# Altium schematic sheet NTC.SchDoc
size A4; SheetNumber: 6; SheetTotal: 6
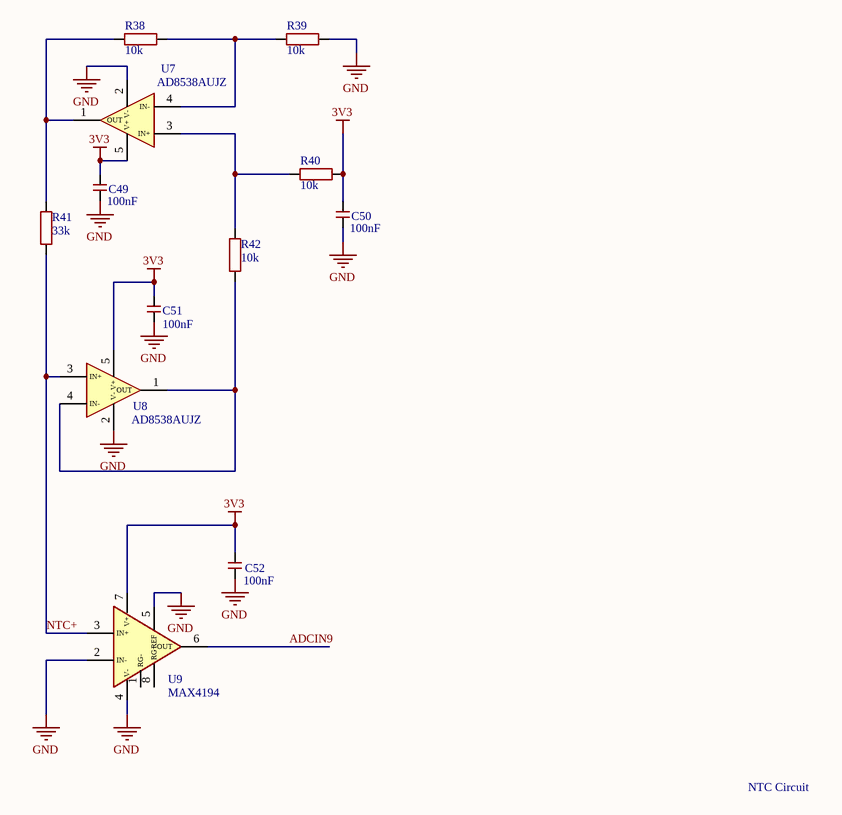
[diagram p0: NTC.SchDoc]

## Parts
C49  100nF  [C0402]
C50  100nF  [C0402]
C51  100nF  [C0402]
C52  100nF  [C0402]
R38  10k  [R0402]
R39  10k  [R0402]
R40  10k  [R0402]
R41  33k  [R0402]
R42  10k  [R0402]
U7  AD8538AUJZ  [SOT95P280X100-5N]
U8  AD8538AUJZ  [SOT95P280X100-5N]
U9  MAX4194  [SOIC127P600X175-8N]

## Nets
3V3: C49.2 C50.2 C51.2 C52.2 R40.2 U7.5(V+) U8.5(V+) U9.7(V+)
GND: C49.1 C50.1 C51.1 C52.1 R39.2 U7.2(V-) U8.2(V-) U9.2(IN-) U9.4(V-) U9.5(REF)
ADCIN9: U9.6(OUT)
NTC+: R41.1 U8.3(IN+) U9.3(IN+)
NetR38_1: R38.1 R41.2 U7.1(OUT)
NetR38_2: R38.2 R39.1 U7.4(IN-)
NetR40_1: R40.1 R42.2 U7.3(IN+)
NetR42_1: R42.1 U8.1(OUT) U8.4(IN-)

Not connected (* = marked no-connect by the designer): U9 1(RG-) 8(RG+)

## Notes on the sheet
- NTC Circuit

## Library data of the parts
C49-C52 = C0402C104K3PACTU: Ceramic Capacitor, Multilayer, Ceramic, 25V, 10% +Tol, 10% -Tol, X5R, 15% TC, 0.1uF, Surface Mount, 0402; Manufacturer: KEMET; Multilayer: Yes; Supplier: Mouser; Supplier Part Number: 80-C0402C104K3P; Manufacturer Part Number: C0402C104K3PACTU; RoHS: Yes; Category: Ceramic Capacitors; Stock: 262570; Pricing: 1=0.12, 10=0.056, 50=0.056, 100=0.036, 1000=0.026, 10000=0.017 (USD); Mounting Technology: Surface Mount; Pins: 2; Dielectric Material: Ceramic; Package Shape: Rectangular; Case/Package: 0402; Terminal Finish: Nickel; Min Operating Temperature: -55°C; Max Operating Temperature: 85°C; JESD-609 Code: e3; Value: 100nF; Capacitor Type: Ceramic; Tolerance  (fill in as +-): 10%; Packaging: Tape and Reel; Tolerance (fill in as +-): 10%; Rated DC Voltage (URdc): 25V; Temperature Characteristics Code: X5R; Termination: Wraparound; Reach SVHC Compliant: Yes; RoHS Compliant: Yes; ComponentLink1URL: https://datasheet.ciiva.com:443/pdfs/VipMasterIC/IC/KEME/KEME-S-A0008991665/KEME-S-A0008991665-1.pdf?src-supplier=IHS+Markit; ComponentLink1Description: https://datasheet.ciiva.com:443/pdfs/VipMasterIC/IC/KEME/KEME-S-A0008991665/KEME-S-A0008991665-1.pdf?src-supplier=IHS+Markit; ComponentLink2URL: http://www.farnell.com/datasheets/2748284.pdf?src-supplier=Farnell; ComponentLink2Description: http://www.farnell.com/datasheets/2748284.pdf?src-supplier=Farnell; ComponentLink3URL: http://www.farnell.com/datasheets/2748284.pdf?src-supplier=Newark; ComponentLink3Description: http://www.farnell.com/datasheets/2748284.pdf?src-supplier=Newark; ComponentLink4URL: https://datasheet.octopart.com/C0402C104K3PACTU-KEMET-datasheet-181956028.pdf?src-supplier=Element14; ComponentLink4Description: https://datasheet.octopart.com/C0402C104K3PACTU-KEMET-datasheet-181956028.pdf?src-supplier=Element14
R38-R40 R42 = RP0402BRD0710KL: Resistor, 10K, 0.1%, 0.063W, THIN FILM, 0402;; Manufacturer: Yageo; Supplier: Mouser; Supplier Part Number: 603-RP0402BRD0710KL; Manufacturer Part Number: RP0402BRD0710KL; RoHS: No; Category: Chip SMD Resistors; Stock: 21771; Pricing: 1=0.24, 10=0.171, 50=0.134, 100=0.12, 1000=0.092, 10000=0.074 (USD); ComponentLink1URL: https://datasheet.octopart.com/RP0402BRD0710KL-Yageo-datasheet-179178423.pdf?src-supplier=Newark; ComponentLink1Description: https://datasheet.octopart.com/RP0402BRD0710KL-Yageo-datasheet-179178423.pdf?src-supplier=Newark
R41 = RC0402FR-7D33KL: Fixed Resistor, Metal Glaze/thick Film, 0.0625W, 33000ohm, 50V, 1% +/-Tol, 100ppm/Cel, Surface Mount, 0402; Manufacturer: Yageo; Supplier: Mouser; Supplier Part Number: 603-RC0402FR-7D33KL; Manufacturer Part Number: RC0402FR-7D33KL; RoHS: Yes; Category: Resistors; Stock: 38172; Pricing: 1=0.1, 10=0.01, 50=0.01, 100=0.007, 1000=0.006, 10000=0.003 (USD)
U7 U8 = AD8538AUJZ-REEL7: Operational Amplifier, 1 Func, 30uV Offset-Max, CMOS, PDSO5; Manufacturer: Analog Devices; Package Body Material: Plastic; Architecture: VOLTAGE-FEEDBACK; Average Bias Current-Max (IIB): 100pA; Bias Current-Max (IIB) @25C: 25pA; Common-mode Reject Ratio-Nom: 135dB; Frequency Compensation: YES; Neg Supply Voltage Limit-Max: 0V; Channels: 1; Package Equivalence Code: TSOP5/6,.11,37; Power: No; Power Supplies: +-1.35/+-2.5/2.7/5V; Slew Rate: 0.4V/µs; Max Supply Current: 215uA; Supply Voltage Limit-Max: 6V; Nominal Supply Voltage: 5V; Time @ Peak Reflow Temperature-Max (s): 40s; Unity Gain BW-Nom: 430kHz; Voltage Gain-Min: 178000; Qualification Status: Not Qualified; Supplier: Mouser; Supplier Part Number: 584-AD8538AUJZ-R7; Manufacturer Part Number: AD8538AUJZ-REEL7; RoHS: Yes; Category: Amplifiers - Op Amps, Buffer, Instrumentation; Stock: 130448; Pricing: 1=1.65, 10=1.42, 50=1.42, 100=1.25, 1000=0.916, 10000=0.84 (USD); Case/Package: VSSOP; Pins: 5; Package Shape: Rectangular; Terminal Finish: Tin; Min Operating Temperature: -40°C; Max Operating Temperature: 125°C; JESD-609 Code: e3; Amplifier Type: OPERATIONAL AMPLIFIER; Input Offset Voltage-Max: 30uV; JESD-30 Code: R-PDSO-G5; Low-Bias: Yes; Low-Offset: Yes; Micropower: Yes; Moisture Sensitivity Level: 1; Neg Supply Voltage-Nom (Vsup): 0V; Package Style: SMALL OUTLINE, VERY THIN PROFILE, SHRINK PITCHMeter; Packaging: Tape and Reel; Peak Reflow Temperature (Cel): 260°C; Programmable Power: No; Surface Mount: Yes; Technology: CMOS; Terminal Form: Gull Wing; Terminal Position: DUAL; Wideband: No; Length: 2.9mm; Width: 1.6mm; Height - Seated (Max): 1mm; Terminal Pitch: 0.95mm; Temperature Grade: AUTOMOTIVE; Reach SVHC Compliant: Yes; RoHS Compliant: Yes; ComponentLink1URL: https://datasheet.ciiva.com:443/pdfs/VipMasterIC/IC/ANDI/ANDIS13894/ANDIS13894-1.pdf?src-supplier=IHS+Markit; ComponentLink1Description: https://datasheet.ciiva.com:443/pdfs/VipMasterIC/IC/ANDI/ANDIS13894/ANDIS13894-1.pdf?src-supplier=IHS+Markit; ComponentLink2URL: https://datasheet.ciiva.com/15374/ad8538-8539-243268-15374656.pdf?src-supplier=Mouser; ComponentLink2Description: https://datasheet.ciiva.com/15374/ad8538-8539-243268-15374656.pdf?src-supplier=Mouser; ComponentLink3URL: https://datasheet.ciiva.com/2974/ad8538-8539-2974672.pdf?src-supplier=Avnet; ComponentLink3Description: https://datasheet.ciiva.com/2974/ad8538-8539-2974672.pdf?src-supplier=Avnet; ComponentLink4URL: https://datasheet.ciiva.com/1793/ad8538-8539-1793940.pdf?src-supplier=Digikey; ComponentLink4Description: https://datasheet.ciiva.com/1793/ad8538-8539-1793940.pdf?src-supplier=Digikey; ComponentLink5URL: https://datasheet.ciiva.com/1793/ad8538-8539-1793941.pdf?src-supplier=Digikey; ComponentLink5Description: https://datasheet.ciiva.com/1793/ad8538-8539-1793941.pdf?src-supplier=Digikey; ComponentLink6URL: https://datasheet.ciiva.com/1793/ad8538-8539-1793942.pdf?src-supplier=Digikey; ComponentLink6Description: https://datasheet.ciiva.com/1793/ad8538-8539-1793942.pdf?src-supplier=Digikey; ComponentLink7URL: https://datasheet.ciiva.com/2973/ad8538-8539-2973062.pdf?src-supplier=Avnet; ComponentLink7Description: https://datasheet.ciiva.com/2973/ad8538-8539-2973062.pdf?src-supplier=Avnet
U9 = MAX4194ESA+: Instrumentation Amplifier, 1 Func, 690uV Offset-Max, 0.25MHz Band Width, PDSO8; Manufacturer: Maxim; Package Body Material: Plastic; Average Bias Current-Max (IIB): 20nA; Bandwidth (3dB)-Nom: 250kHz; Common Mode Rejection Ratio-Min: 73dB; Input Offset Current-Max (IIO): 3nA; Channels: 1; Package Equivalence Code: SOP8,.25; Power Supplies: +-1.35/+-3.75/2.7/7.5V; Slew Rate: 0.06V/µs; Max Supply Current: 110uA; Supply Voltage Limit-Max: 8V; Nominal Supply Voltage: 5V; Time @ Peak Reflow Temperature-Max (s): 30s; Voltage Gain-Max: 10000; Qualification Status: Not Qualified; Supplier: Mouser; Supplier Part Number: 700-MAX4194ESA; Manufacturer Part Number: MAX4194ESA+; RoHS: Yes; Category: Amplifiers - Op Amps, Buffer, Instrumentation; Stock: 2146; Pricing: 1=7.06, 10=5.31, 50=5.17, 100=4.65, 1000=3.83, 10000=3.83 (USD); Case/Package: SOP; Pins: 8; Terminal Finish: Tin; Package Shape: Rectangular; Min Operating Temperature: -40°C; Max Operating Temperature: 85°C; Amplifier Type: INSTRUMENTATION AMPLIFIER; JESD-609 Code: e3; Moisture Sensitivity Level: 1; Input Offset Voltage-Max: 690uV; JESD-30 Code: R-PDSO-G8; Package Style: SMALL OUTLINEMeter; Peak Reflow Temperature (Cel): 260°C; Surface Mount: Yes; Terminal Form: Gull Wing; Terminal Position: DUAL; Voltage Gain-Min: 1; Length: 4.9mm; Width: 3.9mm; Height - Seated (Max): 1.75mm; Terminal Pitch: 1.27mm; Reach SVHC Compliant: Yes; RoHS Compliant: Yes; Temperature Grade: INDUSTRIAL; ComponentLink1URL: https://datasheet.ciiva.com:443/pdfs/VipMasterIC/IC/MAXM/MAXMS15090/MAXMS15090-1.pdf?src-supplier=IHS+Markit; ComponentLink1Description: https://datasheet.ciiva.com:443/pdfs/VipMasterIC/IC/MAXM/MAXMS15090/MAXMS15090-1.pdf?src-supplier=IHS+Markit; ComponentLink2URL: https://datasheet.ciiva.com/2975/max4194-max4197-2975858.pdf?src-supplier=Avnet; ComponentLink2Description: https://datasheet.ciiva.com/2975/max4194-max4197-2975858.pdf?src-supplier=Avnet; ComponentLink3URL: https://datasheet.ciiva.com/14338/max4194-max4197-14338475.pdf?src-supplier=Avnet; ComponentLink3Description: https://datasheet.ciiva.com/14338/max4194-max4197-14338475.pdf?src-supplier=Avnet; ComponentLink4URL: https://datasheet.ciiva.com/1802/max4194-max4197-1802609.pdf?src-supplier=Digikey; ComponentLink4Description: https://datasheet.ciiva.com/1802/max4194-max4197-1802609.pdf?src-supplier=Digikey; ComponentLink5URL: https://datasheet.ciiva.com/1819/max4194-max4197-1819822.pdf?src-supplier=Digikey; ComponentLink5Description: https://datasheet.ciiva.com/1819/max4194-max4197-1819822.pdf?src-supplier=Digikey